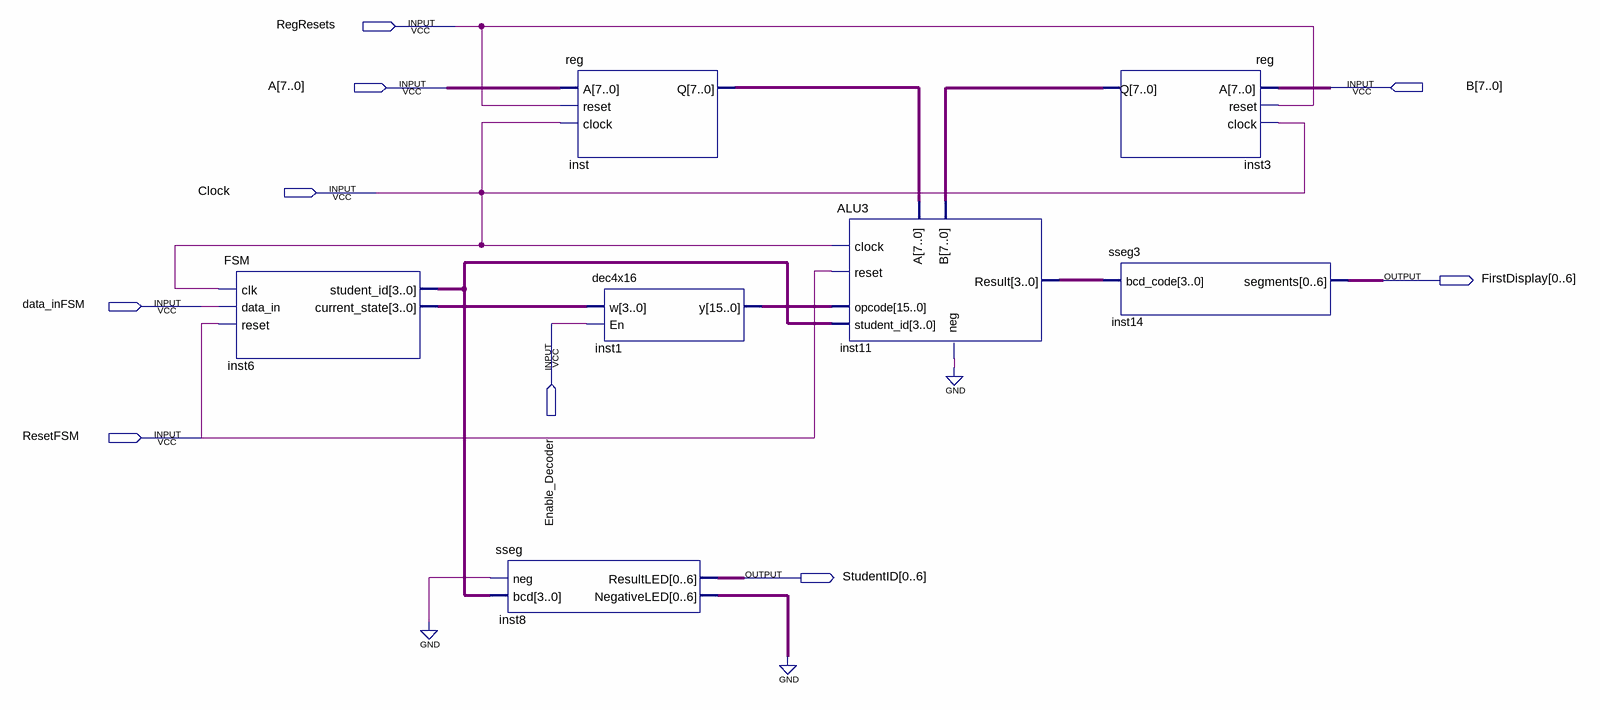
[diagram p0: schematic sheet]
// Quartus schematic GPU.bdf as structural Verilog: 7 symbols, 9 pins
module GPU (
  input  RegResets,
  input  [7:0] A,
  input  [7:0] B,
  input  Clock,
  input  data_inFSM,
  input  Enable_Decoder,
  input  ResetFSM,
  output [0:6] FirstDisplay,
  output [0:6] StudentID
);

  wire inst11_neg;
  wire [3:0] inst6_current_state, inst6_student_id, inst11_result;
  wire [6:0] inst8_negativeled;
  wire [7:0] inst3_q, inst_q;
  wire [15:0] inst1_y;

  FSM inst6 (
    .clk(Clock), .data_in(data_inFSM), .reset(ResetFSM), .student_id(inst6_student_id),
    .current_state(inst6_current_state));
  sseg inst8 (.neg(1'b0), .bcd(inst6_student_id), .ResultLED(StudentID), .NegativeLED(inst8_negativeled));
  \reg  inst (.A(A), .reset(RegResets), .clock(Clock), .Q(inst_q));
  dec4x16 inst1 (.w(inst6_current_state), .En(Enable_Decoder), .y(inst1_y));
  ALU3 inst11 (
    .clock(Clock), .reset(ResetFSM), .A(inst_q), .B(inst3_q), .opcode(inst1_y),
    .student_id(inst6_student_id), .Result(inst11_result), .neg(inst11_neg));
  \reg  inst3 (.A(B), .reset(RegResets), .clock(Clock), .Q(inst3_q));
  sseg3 inst14 (.bcd_code(inst11_result), .segments(FirstDisplay));
  // also tied to GND on the sheet: {inst8_negativeled[0], inst8_negativeled[1], inst8_negativeled[2], inst8_negativeled[3], inst8_negativeled[4], inst8_negativeled[5], inst8_negativeled[6], inst11_neg}
endmodule
